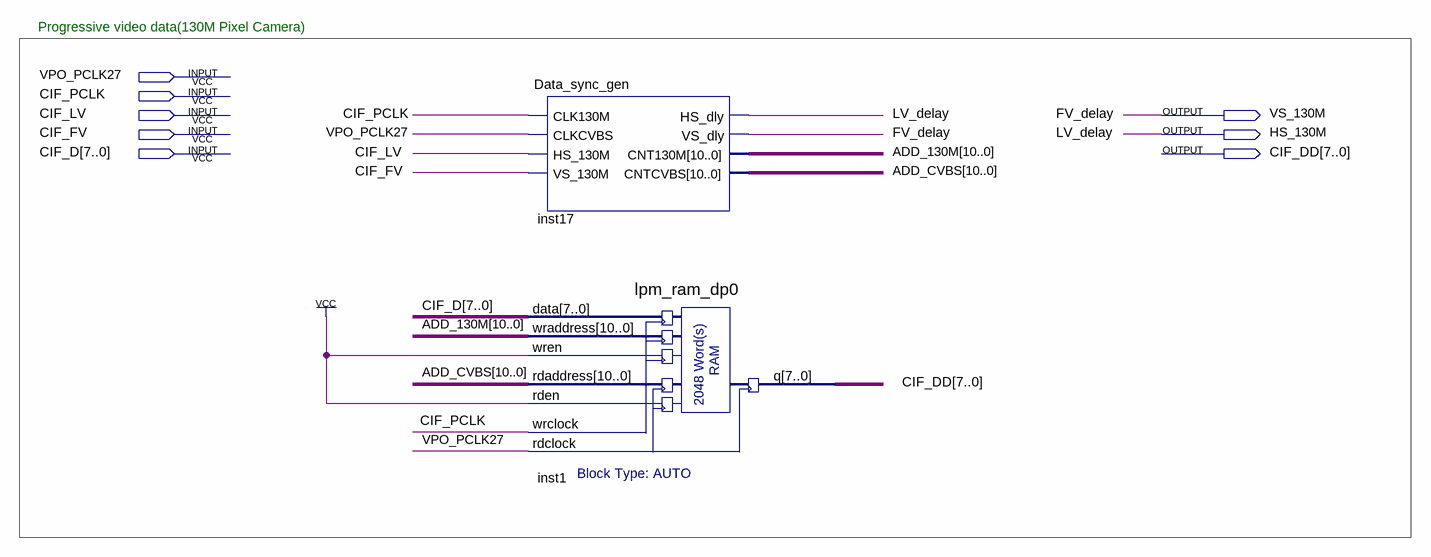
[diagram p0: schematic sheet]
// Quartus schematic VIDEO_in.bdf as structural Verilog: 2 symbols, 8 pins
module VIDEO_in (
  input  VPO_PCLK27,
  input  CIF_PCLK,
  input  CIF_LV,
  input  CIF_FV,
  input  [7:0] CIF_D,
  output VS_130M,
  output HS_130M,
  output [7:0] CIF_DD
);

  wire [10:0] ADD_130M, ADD_CVBS;

  Data_sync_gen inst17 (
    .CLK130M(CIF_PCLK), .CLKCVBS(VPO_PCLK27), .HS_130M(CIF_LV), .VS_130M(CIF_FV), .HS_dly(HS_130M),
    .VS_dly(VS_130M), .CNT130M(ADD_130M), .CNTCVBS(ADD_CVBS));
  lpm_ram_dp0 inst1 (
    .data(CIF_D), .wraddress(ADD_130M), .wren(1'b1), .rdaddress(ADD_CVBS), .rden(1'b1), .wrclock(CIF_PCLK),
    .rdclock(VPO_PCLK27), .q(CIF_DD));

  // Other names for the same wires on the sheet: FV_delay = VS_130M; LV_delay = HS_130M

  // Notes on the sheet:
  //   Progressive video data(130M Pixel Camera)
endmodule
